# Altium project PamisBrainBoard.PrjPcb (part 1 of 2)
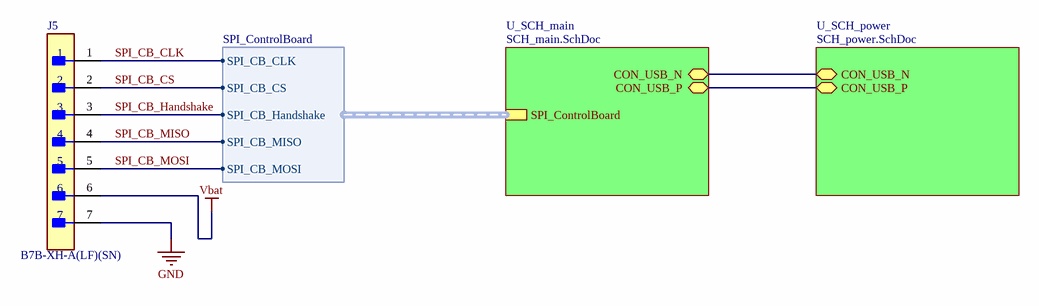
[diagram p0: SCH_Groupe.SchDoc]
3 sheets, 48 parts. Net scope: hierarchical (ports join the sheet entries above them; power ports are global).
Board file: PCB_BrainBoard.PcbDoc
Sheets:
  SCH_Groupe.SchDoc
    U_SCH_power = SCH_Power.SchDoc
    U_SCH_main = SCH_main.SchDoc

## Sheet SCH_Groupe.SchDoc: Brain Board
size 297 x 209 mm; DrawnBy: Adnan CATAL; SheetNumber: 1; SheetTotal: 3; Designer: Adnan CATAL; Projet: Pamis; Title2: Main shematics

### Parts
J5  B7B-XH-A(LF)(SN)  [FP-B7B-XH-A_LF_SN-MFG]

### Sub-sheets
U_SCH_main = SCH_main.SchDoc: SPI_ControlBoard (harness SPI_ControlBoard), CON_USB_P (bidir), CON_USB_N (bidir)
U_SCH_power = SCH_power.SchDoc: CON_USB_P (bidir), CON_USB_N (bidir)

### Harnesses
SPI_ControlBoard: SPI_CB_CLK, SPI_CB_CS, SPI_CB_Handshake, SPI_CB_MOSI, SPI_CB_MISO

### Nets
GND: J5.7
Vbat: J5.6
CON_USB_N: sheet U_SCH_power/CON_USB_N, sheet U_SCH_main/CON_USB_N
CON_USB_P: sheet U_SCH_power/CON_USB_P, sheet U_SCH_main/CON_USB_P
SPI_CB_CLK: J5.1 ; sheet U_SCH_main/SPI_ControlBoard.SPI_CB_CLK
SPI_CB_CS: J5.2 ; sheet U_SCH_main/SPI_ControlBoard.SPI_CB_CS
SPI_CB_Handshake: J5.3 ; sheet U_SCH_main/SPI_ControlBoard.SPI_CB_Handshake
SPI_CB_MISO: J5.4 ; sheet U_SCH_main/SPI_ControlBoard.SPI_CB_MISO
SPI_CB_MOSI: J5.5 ; sheet U_SCH_main/SPI_ControlBoard.SPI_CB_MOSI

### Notes on the sheet
- Project/Equipment
- Document
- Designer
- Drawn by
- Check.by
- File
- Last Mod.
- Print Date
- Sheet
- of
- Size
- A4
- Rev

### Library data of the parts
J5 = CMP-17439-000323-2: CONN HEADER VERT 7POS 2.5MM; Current Rating: 3A; Voltage Rating: 250V; Number of Contacts: 7; Mated Stacking Heights: 9.8mm; Insulation Resistance: 1GR; Contact Resistance: 20mR; Wire/Cable Gauge: 22AWG; Contact Finish - Mating: TIN; Orientation: Straight; REACH SVHC: No SVHC; Max Operating Temperature: 85°C; Housing Color: White; Pitch: 2.5mm; Mount: Through Hole; Packaging: Bulk; Depth: 5.75mm; Series: XH; Min Operating Temperature: -25°C; Length: 19.9mm; Connector Type: Header; Number of Positions: 7; Color: Natural; Max Current Rating: 3A; Lead Pitch: 2.5mm; Termination: Solder; Fastening Type: Detent; Flammability Rating: UL94 V-0; Voltage Rating (AC): 250V; Lead Free: Lead Free; Contact Material: Brass; Max Voltage Rating (AC): 250V; Contact Type: Male Pin; Housing Material: Polyamide; Insulation Color: Natural; Contact Shape: Square; Number of Rows: 1; Contact Plating: Tin; Insulation Material: Nylon

## Sheet SCH_Power.SchDoc: Brain Board
size 297 x 209 mm; SPICEModelCacheCRLNPAUY: <root> / <DocumentId>CRLNPAUY</DocumentId> / </root>; CreateDate: 26/10/2026; Projet: Pamis; DrawnBy: Adnan CATAL; SheetNumber: 3; SheetTotal: 3; Designer: Adnan CATAL; Title2: Power Schematic
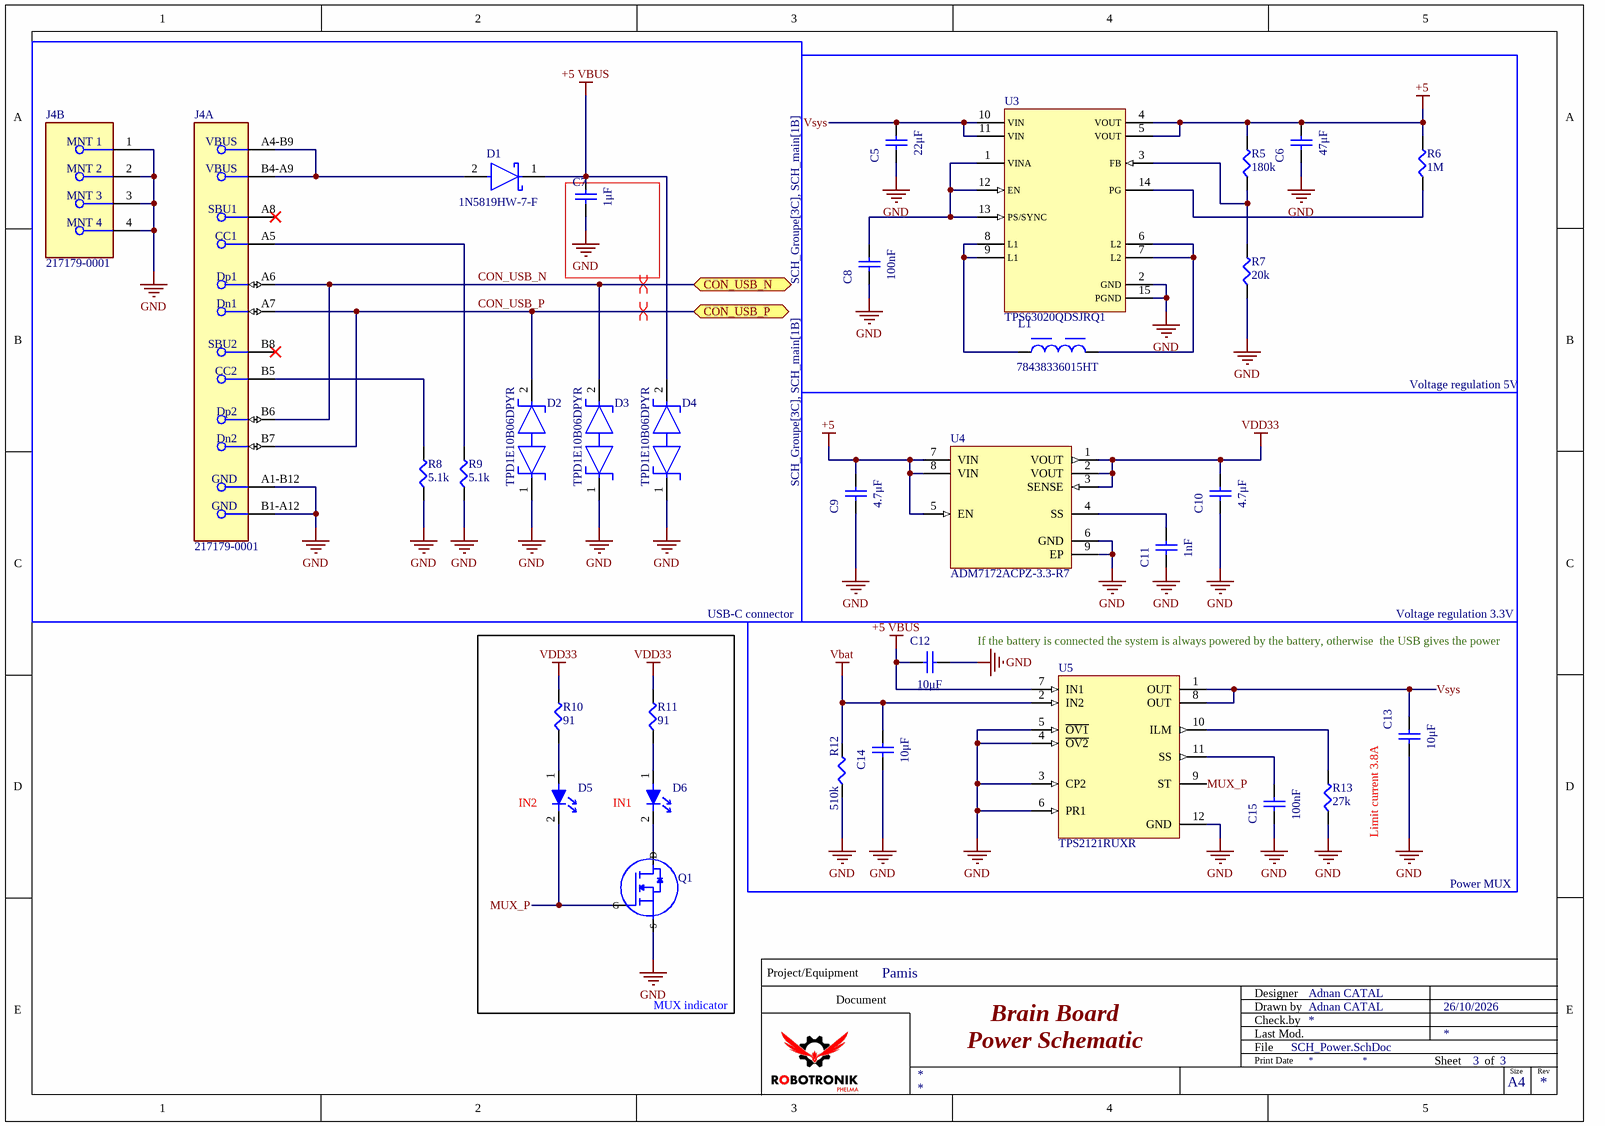
[diagram p1: SCH_Power.SchDoc]

### Parts
C5  22μF  [WCAP-CSGP_0805_L2W1.25H1.25]
C6  47μF  [WCAP-CSGP_0805_L2W1.25H1.25]
C7  1μF  [WCAP-CSGP_0603_L1.6W0.8H0.8_Reflow]
C8  100nF  [WCAP-CSGP_0805_L2W1.25H0.8_Reflow]
C9  4.7μF  [WCAP-CSGP_0603_L1.6W0.8H0.8_Reflow]
C10  4.7μF  [WCAP-CSGP_0603_L1.6W0.8H0.8_Reflow]
C11  1nF  [WCAP-CSGP_0603_L1.6W0.8H0.8_Reflow]
C12  10μF  [WCAP-CSGP_0805_L2W1.25H1.25]
C13  10μF  [WCAP-CSGP_0805_L2W1.25H1.25]
C14  10μF  [WCAP-CSGP_0805_L2W1.25H1.25]
C15  100nF  [WCAP-CSGP_0805_L2W1.25H0.8_Reflow]
D1  1N5819HW-7-F  [FP-SOD123-IPC_A]
D2  TPD1E10B06DPYR  [FP-DPY0002A-MFG]
D3  TPD1E10B06DPYR  [FP-DPY0002A-MFG]
D4  TPD1E10B06DPYR  [FP-DPY0002A-MFG]
D5  Yellow Green  [DIOC2012X30N]  (value not drawn)
D6  Yellow Green  [DIOC2012X30N]  (value not drawn)
J4  217179-0001  [FP-2171790001-MFG]  (parts A,B of 2)
L1  78438336015HT  [WE-MAIA_3020HT]
Q1  DMN2058U-7  [SOT90P240X110-3N]  (value not drawn)
R5  180k  [SMD-0603-RES]
R6  1M  [SMD-0603-RES]
R7  20k  [SMD-0603-RES]
R8  5.1k  [SMD-0603-RES]
R9  5.1k  [SMD-0603-RES]
R10  91  [SMD-0603-RES]
R11  91  [SMD-0603-RES]
R12  510k  [SMD-0603-RES]
R13  27k  [SMD-0603-RES]
U3  TPS63020QDSJRQ1  [SON50P300X400X100-15N]
U4  ADM7172ACPZ-3.3-R7  [SON50P300X300X80-9N]
U5  TPS2121RUXR  [IC_TPS2121RUXR]

### Ports
CON_USB_N (bidir, see SCH_Groupe[3C], SCH_main[1B]), CON_USB_P (bidir, see SCH_Groupe[3C], SCH_main[1B])

### Nets
+5: C6.2 C9.2 R5.2 R6.2 U3.4(VOUT) U3.5(VOUT) U4.5(EN) U4.7(VIN) U4.8(VIN)
+5 VBUS: C7.2 C12.1 D1.1(C) D4.2 U5.7(IN1)
GND: C5.1 C6.1 C7.1 C8.1 C9.1 C10.1 C11.1 C12.2 C13.1 C14.1 C15.1 D2.1 D3.1 D4.1 J4.1(MNT_1) J4.2(MNT_2) J4.3(MNT_3) J4.4(MNT_4) J4.A1-B12(GND) J4.B1-A12(GND) Q1.2(S) R7.1 R8.1 R9.1 R12.1 R13.1 U3.2(GND) U3.15(PGND) U4.6(GND) U4.9(EP) U5.3(CP2) U5.4(~{OV2}) U5.5(~{OV1}) U5.6(PR1) U5.12(GND)
Vbat: C14.2 R12.2 U5.2(IN2)
VDD33: C10.2 R10.2 R11.2 U4.1(VOUT) U4.2(VOUT) U4.3(SENSE)
CON_USB_N: D3.2 J4.A6(Dp1) J4.B6(Dp2) ; port CON_USB_N
CON_USB_P: D2.2 J4.A7(Dn1) J4.B7(Dn2) ; port CON_USB_P
MUX_P: D5.2 Q1.1(G) U5.9(ST)
Vsys: C5.2 C13.2 U3.10(VIN) U3.11(VIN) U5.1(OUT) U5.8(OUT)
NetC8_2: C8.2 U3.1(VINA) U3.12(EN) U3.13(PS/SYNC)
NetC11_2: C11.2 U4.4(SS)
NetC15_2: C15.2 U5.11(SS)
NetD1_2: D1.2(A) J4.A4-B9(VBUS) J4.B4-A9(VBUS)
NetD5_1: D5.1 R10.1
NetD6_1: D6.1 R11.1
NetD6_2: D6.2 Q1.3(D)
NetJ4_A5: J4.A5(CC1) R9.2
NetJ4_B5: J4.B5(CC2) R8.2
NetL1_1: L1.1 U3.8(L1) U3.9(L1)
NetL1_2: L1.2 U3.6(L2) U3.7(L2)
NetR5_1: R5.1 R7.2 U3.3(FB)
NetR6_1: R6.1 U3.14(PG)
NetR13_2: R13.2 U5.10(ILM)

Not connected (* = marked no-connect by the designer): J4 A8(SBU1)* B8(SBU2)*

### Layout directives
differential pair; differential pair class DIFF_USB: CON_USB_N, CON_USB_P

### Notes on the sheet
- Voltage regulation 5V
- USB-C connector
- If the battery is connected the system is always powered by the battery, otherwise  the USB gives the power
- Voltage regulation 3.3V
- (near D5) IN2
- (near D6) IN1
- Limit current 3.8A
- Power MUX
- MUX indicator
- Project/Equipment
- Document
- Designer
- Drawn by
- Check.by
- File
- Last Mod.
- Print Date
- Sheet
- of
- Size
- A4
- Rev

### Library data of the parts
C5 = 885012107019: WCAP-CSGP Multilayer Ceramic Chip Capacitor, General Purpose, size 0805, 22μF, 25V; Manufacturer: Wurth Elektronik; Case/Size Code: 0805; Capacitance Tolerance: +/-20%; Ceramic Type: X5R Class II; Dissipation Factor: 10%; Insulation Resistance: 0.002GΩ; Technical Reference: X5R0805226M025DFCT10000; Manufacturer Part Number: 885012107019; Category: Multilayer Ceramic Chip Capacitors; Match Code: WCAP-CSGP; ComponentLink1Description: Website Link; ComponentLink1URL: https://www.we-online.com/redexpert/article/885012107019?ad; ComponentLink2Description: Datasheet Link; ComponentLink2URL: https://www.we-online.com/redexpert/spec/885012107019?ad; Mount: Surface Mount; Min Operating Temperature: -55°C; Max Operating Temperature: 85°C; Packaging: Tape and Reel; Length: 2mm; Width: 1.25mm; Height: 1.25mm; Capacitance: 22μF; Rated Voltage (DC): 25V
C6 = 885012107006: WCAP-CSGP Multilayer Ceramic Chip Capacitor, General Purpose, size 0805, 47μF, 6.3V; Manufacturer: Wurth Elektronik; Case/Size Code: 0805; Capacitance Tolerance: +/-20%; Ceramic Type: X5R; Dissipation Factor: 10%; Insulation Resistance: 0.002GΩ; Technical Reference: X5R0805476M6R3DFCT10000; Manufacturer Part Number: 885012107006; Category: Multilayer Ceramic Chip Capacitors; Match Code: WCAP-CSGP; ComponentLink1Description: Website Link; ComponentLink1URL: https://www.we-online.com/redexpert/article/885012107006?ad; ComponentLink2Description: Datasheet Link; ComponentLink2URL: https://www.we-online.com/redexpert/spec/885012107006?ad; Mount: Surface Mount; Min Operating Temperature: -55°C; Max Operating Temperature: 85°C; Packaging: Tape and Reel; Length: 2mm; Width: 1.25mm; Height: 1.25mm; Capacitance: 47μF; Rated Voltage (DC): 6.3V
C7 = 885012106003: WCAP-CSGP Multilayer Ceramic Chip Capacitor, General Purpose, size 0603, 1μF, 6.3V; Manufacturer: Wurth Elektronik; Case/Size Code: 0603; Capacitance Tolerance: +/-20%; Ceramic Type: X5R; Dissipation Factor: 10%; Insulation Resistance: 0.1GΩ; Technical Reference: X5R0603105M6R3DFCT10000; Manufacturer Part Number: 885012106003; Category: Multilayer Ceramic Chip Capacitors; Match Code: WCAP-CSGP; ComponentLink1Description: Website Link; ComponentLink1URL: https://www.we-online.com/redexpert/article/885012106003?ad; ComponentLink2Description: Datasheet Link; ComponentLink2URL: https://www.we-online.com/redexpert/spec/885012106003?ad; Mount: Surface Mount; Min Operating Temperature: -55°C; Max Operating Temperature: 85°C; Packaging: Tape and Reel; Length: 1.6mm; Width: 0.8mm; Height: 0.8mm; Capacitance: 1μF; Rated Voltage (DC): 6.3V
C8 C15 = 885012207045: WCAP-CSGP Multilayer Ceramic Chip Capacitor, General Purpose, size 0805, 100nF, 16V; Manufacturer: Wurth Elektronik; Case/Size Code: 0805; Capacitance Tolerance: +/-10%; Ceramic Type: X7R; Dissipation Factor: 3.5%; Insulation Resistance: 5GΩ; Technical Reference: X7R0805104K016DFCT10000; Manufacturer Part Number: 885012207045; Category: Multilayer Ceramic Chip Capacitors; Match Code: WCAP-CSGP; ComponentLink1Description: Website Link; ComponentLink1URL: https://www.we-online.com/redexpert/article/885012207045?ad; ComponentLink2Description: Datasheet Link; ComponentLink2URL: https://www.we-online.com/redexpert/spec/885012207045?ad; Mount: Surface Mount; Min Operating Temperature: -55°C; Max Operating Temperature: 125°C; Packaging: Tape and Reel; Length: 2mm; Width: 1.25mm; Height: 0.8mm; Capacitance: 100nF; Rated Voltage (DC): 16V
C9 C10 = 885012106012: WCAP-CSGP Multilayer Ceramic Chip Capacitor, General Purpose, size 0603, 4.7μF, 10V; Manufacturer: Wurth Elektronik; Case/Size Code: 0603; Capacitance Tolerance: +/-20%; Ceramic Type: X5R; Dissipation Factor: 10%; Insulation Resistance: 0.02GΩ; Technical Reference: X5R0603475M010DFCT10000; Manufacturer Part Number: 885012106012; Category: Multilayer Ceramic Chip Capacitors; Match Code: WCAP-CSGP; ComponentLink1Description: Website Link; ComponentLink1URL: https://www.we-online.com/redexpert/article/885012106012?ad; ComponentLink2Description: Datasheet Link; ComponentLink2URL: https://www.we-online.com/redexpert/spec/885012106012?ad; Mount: Surface Mount; Min Operating Temperature: -55°C; Max Operating Temperature: 85°C; Packaging: Tape and Reel; Length: 1.6mm; Width: 0.8mm; Height: 0.8mm; Capacitance: 4.7μF; Rated Voltage (DC): 10V
C11 = 885012006029: WCAP-CSGP Multilayer Ceramic Chip Capacitor, General Purpose, size 0603, 1nF, 16V; Manufacturer: Wurth Elektronik; Case/Size Code: 0603; Capacitance Tolerance: +/-5%; Ceramic Type: NP0; Insulation Resistance: 10GΩ; Q Factor: 1000; Technical Reference: NP00603102J016DFCT10000; Manufacturer Part Number: 885012006029; Category: Multilayer Ceramic Chip Capacitors; Match Code: WCAP-CSGP; ComponentLink1Description: Website Link; ComponentLink1URL: https://www.we-online.com/redexpert/article/885012006029?ad; ComponentLink2Description: Datasheet Link; ComponentLink2URL: https://www.we-online.com/redexpert/spec/885012006029?ad; Mount: Surface Mount; Min Operating Temperature: -55°C; Max Operating Temperature: 125°C; Packaging: Tape and Reel; Length: 1.6mm; Width: 0.8mm; Height: 0.8mm; Capacitance: 1nF; Rated Voltage (DC): 16V
C12-C14 = 885012107027: WCAP-CSGP Multilayer Ceramic Chip Capacitor, General Purpose, size 0805, 10μF, 25V; Manufacturer: Wurth Elektronik; Case/Size Code: 0805; Capacitance Tolerance: +/-10%; Ceramic Type: X5R Class II; Dissipation Factor: 12.5%; Insulation Resistance: 0.005GΩ; Technical Reference: X5R0805106K025DFCT10000; Manufacturer Part Number: 885012107027; Category: Multilayer Ceramic Chip Capacitors; Match Code: WCAP-CSGP; ComponentLink1Description: Website Link; ComponentLink1URL: https://www.we-online.com/redexpert/article/885012107027?ad; ComponentLink2Description: Datasheet Link; ComponentLink2URL: https://www.we-online.com/redexpert/spec/885012107027?ad; Mount: Surface Mount; Min Operating Temperature: -55°C; Max Operating Temperature: 85°C; Packaging: Tape and Reel; Length: 2mm; Width: 1.25mm; Height: 1.25mm; Capacitance: 10μF; Rated Voltage (DC): 25V
D1 = CMP-0303-00003-3: DIODE SCHOTTKY 40V 1A SOD123; Forward Voltage: 450mV; Capacitance: 110pF; Max Forward Surge Current (Ifsm): 25A; Peak Reverse Current: 50uA; Polarity: Standard; Element Configuration: Single; Max Power Dissipation: 450mW; Min Operating Temperature: -65°C; Package Quantity: 3000; Contact Plating: Tin; Weight: 0.000353oz; Max Repetitive Reverse Voltage (Vrrm): 40V; Max Reverse Voltage (DC): 40V; Height: 1.25mm; Average Rectified Current: 1A; Width: 1.7mm; Case/Package: SOD-123-2; Lead Free: Lead Free; Max Operating Temperature: 125°C; Current Rating: 1A; Termination: SMD/SMT; Forward Current: 1A; Radiation Hardening: No; Number of Pins: 2; Length: 2.85mm; Voltage Rating (DC): 40V; REACH SVHC: No SVHC; Peak Non-Repetitive Surge Current: 25A; Packaging: Tape and Reel; Output Current: 1A
D2-D4 = CMP-0326-00004-4: TVS DIODE 5.5V 14V 2X1SON; Leakage Current: 100nA; Min Breakdown Voltage: 6V; Number of Channels: 1; ESD Protection: Yes; Power Line Protection: No; Test Current: 1mA; Interface: GPIO; Element Configuration: Single; Peak Pulse Current: 5A; Direction: Bidirectional; Peak Pulse Power: 90W; Capacitance: 12pF; Composition: Zener; Packaging: Tape and Reel; Number of Pins: 2; Breakdown Voltage: 6V; Radiation Hardening: No; Min Operating Temperature: -40°C; Contact Plating: Gold; Lead Free: Lead Free; Height: 0.35mm; REACH SVHC: No SVHC; Case/Package: 0402; Max Operating Temperature: 125°C; Width: 0.7mm; Clamping Voltage: 14V; Package Quantity: 1; Max Reverse Leakage Current: 100nA; Working Voltage: 5.5V; Length: 1.1mm; Number of Bidirectional Channels: 1; Reverse Standoff Voltage: 5.5V
D5 D6 = 2545731: 573nm 120° 1.6V~2.4V Green Transparent Yellow SMD 2mm × 1.5mm; Manufacturer: RS Pro; Supplier: RS; Supplier Part Number: 2545731; Manufacturer Part Number: 2545731; Category: LEDs; Stock: 7800; Pricing: 50=0,038, 250=0,037, 500=0,034, 1250=0,03, 5000=0,022 (EUR); Harmonized Tariff Schedule (HTS) Code: 8541.40.20.00; Introduction Date: 2022-12-15
J4 = CMP-04767-000028-2: CONN RCP USB2.0 TYP C 24P SMD RA; NexarPartId: 117190526; Gender: Receptacle; Number of Contacts: 16; Current Rating: 1.25A; Voltage Rating: 30V; Min Operating Temperature: -40°C; USB Standard: USB 2.0; Height: 3.36mm; Contact Material: Gold, Nickel; Max Operating Temperature: 85°C
L1 = CMP-03913-159362465-1: Power Inductor, 1.5UH, 5.2A, Shielded Rohs Compliant: Yes; Manufacturer: Wurth Elektronik; Manufacturer Lifecycle Status: ACTIVE; DC Resistance (DCR): 35.2mΩ; Value: 1.5µH; Saturation Current: 2.4A; YEOL: 1 = Estimated lifetime > 10 years; Supplier: RS; Supplier Part Number: 426953; Manufacturer Part Number: 78438336015HT; RoHS: Compliant; Category: Fixed Inductors; Stock: 995; Pricing: 5=2,168, 50=2,056, 100=1,906, 500=1,754 (EUR); Ambient Temperature Range High: 110°C; Ambient Temperature Range Low: -55°C; Height: 2mm; Length: 3mm; Lifecycle Status: Production; Max Operating Temperature: 150°C; Min Operating Temperature: -55°C; Width: 3mm; ComponentLink1URL: https://datasheet.octopart.com:443/78438336015HT-Wurth-Elektronik-datasheet-190369251.pdf?src-supplier=Wurth+Elektronik; ComponentLink1Description: https://datasheet.octopart.com:443/78438336015HT-Wurth-Elektronik-datasheet-190369251.pdf?src-supplier=Wurth+Elektronik
Q1 = DMN2058U-7: Diodes Zetex DMN2058U N-Channel MOSFET, Vds=20 V, 4.6 A, SOT-23, SMD, 3-Pin; Manufacturer: Diodes Inc.; Continuous Drain Current (ID): 4.6A; Drain to Source Resistance: 35mΩ; Drain to Source Voltage (Vds): 20V; Max Power Dissipation: 1.13W; Number of Elements: 1; Supplier: RS; Supplier Part Number: 1333377; Manufacturer Part Number: DMN2058U-7; RoHS: Compliant; Category: MOSFETs; Stock: 16000; Pricing: 50=0,225 (EUR); Case/Package: SOT-23; China RoHS: Compliant; Country of Origin: Mainland China; Export Control Classification Number (ECCN) Code: EAR99; Introduction Date: 2016-09-13; Lifecycle Status: Production; Max Operating Temperature: 150°C; Min Breakdown Voltage: 20V; Min Operating Temperature: -55°C; Number of Terminals: 3; REACH SVHC: Unaffected; Schedule B: 8541290080, 8541290080|8541290080|8541290080|8541290080|8541290080; ComponentLink1URL: https://datasheet.octopart.com:443/DMN2058U-7-Diodes-Inc.-datasheet-180553089.pdf?src-supplier=Newark; ComponentLink1Description: https://datasheet.octopart.com:443/DMN2058U-7-Diodes-Inc.-datasheet-180553089.pdf?src-supplier=Newark; ComponentLink2URL: https://datasheet.octopart.com:443/DMN2058U-7-Diodes-Inc.-datasheet-76801221.pdf?src-supplier=Newark; ComponentLink2Description: https://datasheet.octopart.com:443/DMN2058U-7-Diodes-Inc.-datasheet-76801221.pdf?src-supplier=Newark; ComponentLink3URL: https://datasheet.octopart.com:443/DMN2058U-7-Diodes-Inc.-datasheet-128204454.pdf?src-supplier=TME; ComponentLink3Description: https://datasheet.octopart.com:443/DMN2058U-7-Diodes-Inc.-datasheet-128204454.pdf?src-supplier=TME; ComponentLink4URL: https://sigma.octopart.com:443/138706058/technical_drawing/Diodes-Inc.-DMN2058U-7.pdf?src-supplier=Diodes+Inc+SCT; ComponentLink4Description: https://sigma.octopart.com:443/138706058/technical_drawing/Diodes-Inc.-DMN2058U-7.pdf?src-supplier=Diodes+Inc+SCT
R5 = ERJ-PA3F1803V: RES SMD 180K OHM 1% 1/4W 0603; Manufacturer: Panasonic Electronic Components; Factory Stock: 0; Unit Price (USD): 0.02372; @ qty: 1500; Minimum Quantity: 1; Power (Watts): 0.25W, 1/4W; Temperature Coefficient: ±100ppm/°C; Part Number: ERJ-PA3F1803V; Datasheets: https://industrial.panasonic.com/cdbs/www-data/pdf/RDA0000/AOA0000C243.pdf; Image: //media.digikey.com/Photos/Panasonic%20Photos/MFG_ERJ-P6W%20Series.jpg; Digi-Key Part Number: P180KBYCT-ND; Quantity Available: 3195; Packaging: Cut Tape (CT); Series: ERJ; Part Status: Active; Value: 180k; Tolerance: ±1%; Composition: Thick Film; Features: Automotive AEC-Q200, Pulse Withstanding; Operating Temperature: -55°C ~ 155°C; Package / Case: 0603 (1608 Metric); Supplier Device Package: 0603; Size / Dimension: 0.063" L x 0.031" W (1.60mm x 0.80mm); Height - Seated (Max): 0.022" (0.55mm); Number of Terminations: 2; Failure Rate: -
R6 = ERJ-PA3F1004V: RES SMD 1M OHM 1% 1/4W 0603; Manufacturer: Panasonic Electronic Components; Factory Stock: 0; Unit Price (USD): 0.02372; @ qty: 1500; Minimum Quantity: 1; Power (Watts): 0.25W, 1/4W; Temperature Coefficient: ±100ppm/°C; Part Number: ERJ-PA3F1004V; Datasheets: https://industrial.panasonic.com/cdbs/www-data/pdf/RDA0000/AOA0000C243.pdf; Image: //media.digikey.com/Photos/Panasonic%20Photos/MFG_ERJ-P6W%20Series.jpg; Digi-Key Part Number: P1.0MBYCT-ND; Quantity Available: 16687; Packaging: Cut Tape (CT); Series: ERJ; Part Status: Active; Value: 1M; Tolerance: ±1%; Composition: Thick Film; Features: Automotive AEC-Q200, Pulse Withstanding; Operating Temperature: -55°C ~ 155°C; Package / Case: 0603 (1608 Metric); Supplier Device Package: 0603; Size / Dimension: 0.063" L x 0.031" W (1.60mm x 0.80mm); Height - Seated (Max): 0.022" (0.55mm); Number of Terminations: 2; Failure Rate: -
R7 = ERJ-PA3F2002V: RES SMD 20K OHM 1% 1/4W 0603; Manufacturer: Panasonic Electronic Components; Factory Stock: 0; Unit Price (USD): 0.02372; @ qty: 1500; Minimum Quantity: 1; Power (Watts): 0.25W, 1/4W; Temperature Coefficient: ±100ppm/°C; Part Number: ERJ-PA3F2002V; Datasheets: https://industrial.panasonic.com/cdbs/www-data/pdf/RDA0000/AOA0000C243.pdf; Image: //media.digikey.com/Photos/Panasonic%20Photos/MFG_ERJ-P6W%20Series.jpg; Digi-Key Part Number: P20KBYCT-ND; Quantity Available: 10542; Packaging: Cut Tape (CT); Series: ERJ; Part Status: Active; Value: 20k; Tolerance: ±1%; Composition: Thick Film; Features: Automotive AEC-Q200, Pulse Withstanding; Operating Temperature: -55°C ~ 155°C; Package / Case: 0603 (1608 Metric); Supplier Device Package: 0603; Size / Dimension: 0.063" L x 0.031" W (1.60mm x 0.80mm); Height - Seated (Max): 0.022" (0.55mm); Number of Terminations: 2; Failure Rate: -
R8 R9 = ERJ-PA3F5101V: RES SMD 5.1K OHM 1% 1/4W 0603; Manufacturer: Panasonic Electronic Components; Factory Stock: 0; Unit Price (USD): 0.02372; @ qty: 1500; Minimum Quantity: 1; Power (Watts): 0.25W, 1/4W; Temperature Coefficient: ±100ppm/°C; Part Number: ERJ-PA3F5101V; Datasheets: https://industrial.panasonic.com/cdbs/www-data/pdf/RDA0000/AOA0000C243.pdf; Image: //media.digikey.com/Photos/Panasonic%20Photos/MFG_ERJ-P6W%20Series.jpg; Digi-Key Part Number: P5.1KBYCT-ND; Quantity Available: 15990; Packaging: Cut Tape (CT); Series: ERJ; Part Status: Active; Value: 5.1k; Tolerance: ±1%; Composition: Thick Film; Features: Automotive AEC-Q200, Pulse Withstanding; Operating Temperature: -55°C ~ 155°C; Package / Case: 0603 (1608 Metric); Supplier Device Package: 0603; Size / Dimension: 0.063" L x 0.031" W (1.60mm x 0.80mm); Height - Seated (Max): 0.022" (0.55mm); Number of Terminations: 2; Failure Rate: -
R10 R11 = ERJ-3EKF91R0V: RES SMD 91 OHM 1% 1/10W 0603; Manufacturer: Panasonic Electronic Components; Factory Stock: 0; Unit Price (USD): 0.00379; @ qty: 1500; Minimum Quantity: 1; Power (Watts): 0.1W, 1/10W; Temperature Coefficient: ±100ppm/°C; Part Number: ERJ-3EKF91R0V; Datasheets: http://industrial.panasonic.com/www-cgi/jvcr13pz.cgi?E+PZ+3+AOA0002+ERJ3EKF91R0V+7+WW; Image: //media.digikey.com/Photos/Panasonic%20Photos/MFG_ERJ-P6W%20Series.jpg; Digi-Key Part Number: P91.0HCT-ND; Quantity Available: 54677; Packaging: Cut Tape (CT); Series: ERJ; Part Status: Active; Value: 91; Tolerance: ±1%; Composition: Thick Film; Features: Automotive AEC-Q200; Operating Temperature: -55°C ~ 155°C; Package / Case: 0603 (1608 Metric); Supplier Device Package: 0603; Size / Dimension: 0.063" L x 0.031" W (1.60mm x 0.80mm); Height - Seated (Max): 0.022" (0.55mm); Number of Terminations: 2; Failure Rate: -
R12 = ERJ-PA3F5103V: RES SMD 510K OHM 1% 1/4W 0603; Manufacturer: Panasonic Electronic Components; Factory Stock: 0; Unit Price (USD): 0.02372; @ qty: 1500; Minimum Quantity: 1; Power (Watts): 0.25W, 1/4W; Temperature Coefficient: ±100ppm/°C; Part Number: ERJ-PA3F5103V; Datasheets: https://industrial.panasonic.com/cdbs/www-data/pdf/RDA0000/AOA0000C243.pdf; Image: //media.digikey.com/Photos/Panasonic%20Photos/MFG_ERJ-P6W%20Series.jpg; Digi-Key Part Number: P510KBYCT-ND; Quantity Available: 3355; Packaging: Cut Tape (CT); Series: ERJ; Part Status: Active; Value: 510k; Tolerance: ±1%; Composition: Thick Film; Features: Automotive AEC-Q200, Pulse Withstanding; Operating Temperature: -55°C ~ 155°C; Package / Case: 0603 (1608 Metric); Supplier Device Package: 0603; Size / Dimension: 0.063" L x 0.031" W (1.60mm x 0.80mm); Height - Seated (Max): 0.022" (0.55mm); Number of Terminations: 2; Failure Rate: -
R13 = ERJ-3EKF2702V: RES SMD 27K OHM 1% 1/10W 0603; Manufacturer: Panasonic Electronic Components; Factory Stock: 0; Unit Price (USD): 0.00379; @ qty: 1500; Minimum Quantity: 1; Power (Watts): 0.1W, 1/10W; Temperature Coefficient: ±100ppm/°C; Part Number: ERJ-3EKF2702V; Datasheets: http://industrial.panasonic.com/www-cgi/jvcr13pz.cgi?E+PZ+3+AOA0002+ERJ3EKF2702V+7+WW; Image: //media.digikey.com/Photos/Panasonic%20Photos/MFG_ERJ-P6W%20Series.jpg; Digi-Key Part Number: P27.0KHCT-ND; Quantity Available: 16002; Packaging: Cut Tape (CT); Series: ERJ; Part Status: Active; Value: 27k; Tolerance: ±1%; Composition: Thick Film; Features: Automotive AEC-Q200; Operating Temperature: -55°C ~ 155°C; Package / Case: 0603 (1608 Metric); Supplier Device Package: 0603; Size / Dimension: 0.063" L x 0.031" W (1.60mm x 0.80mm); Height - Seated (Max): 0.022" (0.55mm); Number of Terminations: 2; Failure Rate: -
U3 = TPS63020QDSJRQ1: Switching Regulator, Current-mode, 2A, 2600kHz Switching Freq-Max, BICMOS, PDSO14; Manufacturer: Texas Instruments; Manufacturer Lifecycle Status: ACTIVE; Max Duty Cycle: 100%; Max Supply Voltage: 5.5V; Max Junction Temperature (Tj): 125°C; Min Input Voltage: 1.8V; Min Output Voltage: 1.2V; Number of Outputs: 1; Output Configuration: Positive; Output Type: Adjustable; Quiescent Current: 50µA; Switching Frequency: 2.4MHz; Synchronous Rectifier: Yes; Topology: Buck-Boost; Supplier: DigiKey; Supplier Part Number: 296-43286-1-ND; Manufacturer Part Number: TPS63020QDSJRQ1; RoHS: Compliant; Category: Voltage Regulators - Switching; Stock: 2665; Height: 1mm; Lead Free: Lead Free; Length: 3mm; Lifecycle Status: Production; Max Operating Temperature: 125°C; Max Output Voltage: 5.5V; Min Operating Temperature: -40°C; Min Supply Voltage: 1.8V; Mounting Technology: Surface Mount; Pins: 14; Output Current: 2A; Packaging: Tape & Reel (TR); Schedule B: 8542390000; Thickness: 900µm; Width: 4mm; ComponentLink1URL: https://datasheet.octopart.com:443/TPS63020QDSJRQ1-Texas-Instruments-datasheet-49823712.pdf?src-supplier=Texas+Instruments; ComponentLink1Description: https://datasheet.octopart.com:443/TPS63020QDSJRQ1-Texas-Instruments-datasheet-49823712.pdf?src-supplier=Texas+Instruments; ComponentLink2URL: https://octopart.com:443/opatz8j6/c1?t=_PlhL9x2DhC5kj_RspDZiegst2Pjcy_9vSA66_zuppjomAtxh8eeCyEWgMGgfXy8gLa5JUP9H_sFY7m0oo4wV1IqgyNWPgIvJJupqtj6dfd8itVF4uXJuBAZm-8-5KdURT-rscAAk4exrppObfuTgysDWqXYCWa6g4Er1_Yh9dDDJDseR-GA9P54EzHN3SPr7356tuSvadfqr47za5CxFVn9TQNg0n6ftYFjG23QVqjVCqxpDU9_do17Rge9-GpcbffJGRMgW8xBeG-p9jOxI28gxcA3t1lsqEAUe8NkT9T-De4ixHPzJWQdEQ21idKCidjl-nWmjapctRLk1RCL25uQiA4SFrXYm9BPX9ccWOLSYwzhdM6cw773HQiK6sNIWq2y8fEWUQ-w&src-supplier=Texas+Instruments; ComponentLink2Description: https://octopart.com:443/opatz8j6/c1?t=_PlhL9x2DhC5kj_RspDZiegst2Pjcy_9vSA66_zuppjomAtxh8eeCyEWgMGgfXy8gLa5JUP9H_sFY7m0oo4wV1IqgyNWPgIvJJupqtj6dfd8itVF4uXJuBAZm-8-5KdURT-rscAAk4exrppObfuTgysDWqXYCWa6g4Er1_Yh9dDDJDseR-GA9P54EzHN3SPr7356tuSvadfqr47za5CxFVn9TQNg0n6ftYFjG23QVqjVCqxpDU9_do17Rge9-GpcbffJGRMgW8xBeG-p9jOxI28gxcA3t1lsqEAUe8NkT9T-De4ixHPzJWQdEQ21idKCidjl-nWmjapctRLk1RCL25uQiA4SFrXYm9BPX9ccWOLSYwzhdM6cw773HQiK6sNIWq2y8fEWUQ-w&src-supplier=Texas+Instruments; ComponentLink3URL: https://sigma.octopart.com:443/49262683/technical_drawing/Texas-Instruments-TPS63020QDSJRQ1.pdf?src-supplier=Texas+Instruments; ComponentLink3Description: https://sigma.octopart.com:443/49262683/technical_drawing/Texas-Instruments-TPS63020QDSJRQ1.pdf?src-supplier=Texas+Instruments; ComponentLink4URL: https://datasheet.octopart.com:443/TPS63020QDSJRQ1-Texas-Instruments-datasheet-164483805.pdf?src-supplier=LCSC; ComponentLink4Description: https://datasheet.octopart.com:443/TPS63020QDSJRQ1-Texas-Instruments-datasheet-164483805.pdf?src-supplier=LCSC; ComponentLink5URL: https://datasheet.octopart.com:443/TPS63020QDSJRQ1-Texas-Instruments-datasheet-147652911.pdf?src-supplier=Arrow.cn; ComponentLink5Description: https://datasheet.octopart.com:443/TPS63020QDSJRQ1-Texas-Instruments-datasheet-147652911.pdf?src-supplier=Arrow.cn; ComponentLink6URL: http://sigma.octopart.com:80/reach_statement/Texas-Instruments-company-64.pdf?src-supplier=Compliance+Statements; ComponentLink6Description: http://sigma.octopart.com:80/reach_statement/Texas-Instruments-company-64.pdf?src-supplier=Compliance+Statements; ComponentLink7URL: http://sigma.octopart.com:80/conflict_mineral_statement/Texas-Instruments-company-63.pdf?src-supplier=Compliance+Statements; ComponentLink7Description: http://sigma.octopart.com:80/conflict_mineral_statement/Texas-Instruments-company-63.pdf?src-supplier=Compliance+Statements
U4 = ADM7172ACPZ-3.3-R7: LDO Regulator Pos 3.3V 2A Medical 8-Pin LFCSP EP T/R; Manufacturer: Analog Devices; Manufacturer Lifecycle Status: PRODUCTION; Accuracy: 1.5%; Dropout Voltage: 172mV; Max Supply Voltage: 6.5V; Max Junction Temperature (Tj): 125°C; Min Current Limit: 2.4A; Min Input Voltage: 2.3V; Number of Outputs: 1; Output Type: Fixed; Polarity: Positive; Quiescent Current: 700µA; Supplier: DigiKey; Supplier Part Number: 505-ADM7172ACPZ-3.3-R7CT-ND; Manufacturer Part Number: ADM7172ACPZ-3.3-R7; RoHS: Compliant; Category: Voltage Regulators - Linear; Stock: 650; Height: 800µm; Lead Free: Contains Lead; Lifecycle Status: Production; Max Operating Temperature: 125°C; Max Output current: 2A; Min Operating Temperature: -40°C; Min Supply Voltage: 2.3V; Mounting Technology: Surface Mount; Pins: 8; Number of Regulators: 1; Output Current: 2A; Output Voltage: 3.3V; Schedule B: 8542390000, 8542390000|8542390000|8542390000|8542390000|8542390000|8542390000|8542390000|8542390000|8542390000|8542390000|8542390000|8542390000|8542390000|8542390000|8542390000|8542390000|8542390000|8542390000|8542390000|8542390000|8542390000|8542390000|8542390000|85; ComponentLink1URL: https://octopart.com:443/opatz8j6/c1?t=bexnlEUvTW4ypcfmMwlQqMukjbZ1sFR7u3HjvhF_p0I1qGgozQEmLYCO0KwwxyEbZiH-eJUsaq8roSbEQNHeTfmOLjlUalTxX2N5GzImcnPMgEcSznHyXIFAgYBb3OUFi_TCl-xASKxKL_mduVIwpazwMBHKV180gVIIaW80selJWFwC_3dSvsH907UDuDBRMF5w27S6ay03f3bc-2j1dmxAk8VGKHozbFK1-BDI5ZbzN8PLYE5HGUZO9k9f8snk51CSxxJCoL8hJ4y85Qa6ezUbzh37DwBqbNGjHclmawiQR9L4M29XjpI&src-supplier=Analog+Devices; ComponentLink1Description: https://octopart.com:443/opatz8j6/c1?t=bexnlEUvTW4ypcfmMwlQqMukjbZ1sFR7u3HjvhF_p0I1qGgozQEmLYCO0KwwxyEbZiH-eJUsaq8roSbEQNHeTfmOLjlUalTxX2N5GzImcnPMgEcSznHyXIFAgYBb3OUFi_TCl-xASKxKL_mduVIwpazwMBHKV180gVIIaW80selJWFwC_3dSvsH907UDuDBRMF5w27S6ay03f3bc-2j1dmxAk8VGKHozbFK1-BDI5ZbzN8PLYE5HGUZO9k9f8snk51CSxxJCoL8hJ4y85Qa6ezUbzh37DwBqbNGjHclmawiQR9L4M29XjpI&src-supplier=Analog+Devices; ComponentLink2URL: https://datasheet.octopart.com:443/ADM7172ACPZ-3.3-R7-Analog-Devices-datasheet-48279025.pdf?src-supplier=Analog+Devices; ComponentLink2Description: https://datasheet.octopart.com:443/ADM7172ACPZ-3.3-R7-Analog-Devices-datasheet-48279025.pdf?src-supplier=Analog+Devices; ComponentLink3URL: https://datasheet.octopart.com:443/ADM7172ACPZ-3.3-R7-Analog-Devices-datasheet-38520329.pdf?src-supplier=Analog+Devices; ComponentLink3Description: https://datasheet.octopart.com:443/ADM7172ACPZ-3.3-R7-Analog-Devices-datasheet-38520329.pdf?src-supplier=Analog+Devices; ComponentLink4URL: https://datasheet.octopart.com:443/ADM7172ACPZ-3.3-R7-Analog-Devices-datasheet-28823778.pdf?src-supplier=Analog+Devices; ComponentLink4Description: https://datasheet.octopart.com:443/ADM7172ACPZ-3.3-R7-Analog-Devices-datasheet-28823778.pdf?src-supplier=Analog+Devices; ComponentLink5URL: https://datasheet.octopart.com:443/ADM7172ACPZ-3.3-R7-Analog-Devices-datasheet-138896285.pdf?src-supplier=element14+APAC; ComponentLink5Description: https://datasheet.octopart.com:443/ADM7172ACPZ-3.3-R7-Analog-Devices-datasheet-138896285.pdf?src-supplier=element14+APAC; ComponentLink6URL: https://datasheet.octopart.com:443/ADM7172ACPZ-3.3-R7-Analog-Devices-datasheet-65849620.pdf?src-supplier=Farnell; ComponentLink6Description: https://datasheet.octopart.com:443/ADM7172ACPZ-3.3-R7-Analog-Devices-datasheet-65849620.pdf?src-supplier=Farnell; ComponentLink7URL: https://datasheet.octopart.com:443/ADM7172ACPZ-3.3-R7-Analog-Devices-datasheet-85391316.pdf?src-supplier=Augswan; ComponentLink7Description: https://datasheet.octopart.com:443/ADM7172ACPZ-3.3-R7-Analog-Devices-datasheet-85391316.pdf?src-supplier=Augswan; ComponentLink8URL: http://sigma.octopart.com:80/conflict_mineral_statement/Analog-Devices-company-33.pdf?src-supplier=Compliance+Statements; ComponentLink8Description: http://sigma.octopart.com:80/conflict_mineral_statement/Analog-Devices-company-33.pdf?src-supplier=Compliance+Statements; ComponentLink9URL: https://octopart.com:443/opatz8j6/c1?t=HP60T0laTHBr78PKNnBwM6RqgywCZdwDfs00A3_xvPXBlGZMB0MdxiYSNcNKfNWJXXZOlJEZQVeS8sOHWC_yzBqUXHUhuyAnEWhaxYA1OpH5fwwc5RqAQfGZuhPNXKQY3fp4_FYGdgOr9CJ69_o4g2M3JDXRpDLIoxiy_MvhA51uKxxlNiZkDQDLf5kNOadxR7lyBtK3STOEU-5RWzyenGvMvyyu3RhliVLg2Kl7XMJxgwTREY3xRC-2EhYST3IpebnuTZ5Sou7rm9ykF39dsCzAOMJd78Yclw1sa_MxoQ00ob-bF_4OtKU&src-supplier=Compliance+Statements; ComponentLink9Description: https://octopart.com:443/opatz8j6/c1?t=HP60T0laTHBr78PKNnBwM6RqgywCZdwDfs00A3_xvPXBlGZMB0MdxiYSNcNKfNWJXXZOlJEZQVeS8sOHWC_yzBqUXHUhuyAnEWhaxYA1OpH5fwwc5RqAQfGZuhPNXKQY3fp4_FYGdgOr9CJ69_o4g2M3JDXRpDLIoxiy_MvhA51uKxxlNiZkDQDLf5kNOadxR7lyBtK3STOEU-5RWzyenGvMvyyu3RhliVLg2Kl7XMJxgwTREY3xRC-2EhYST3IpebnuTZ5Sou7rm9ykF39dsCzAOMJd78Yclw1sa_MxoQ00ob-bF_4OtKU&src-supplier=Compliance+Statements
U5 = TPS2121RUXR: 2.7-V to 22-V, 56-mΩ, 4.5-A, power mux with seamless switchover 12-VQFN-HR -40 to 125; Manufacturer: Texas Instruments; Manufacturer Lifecycle Status: ACTIVE; Max Junction Temperature (Tj): 125°C; Max Supply Voltage: 22V; Min Supply Voltage: 2.8V; Nominal Supply Current: 300µA; Number of Outputs: 1; Supplier: DigiKey; Supplier Part Number: 296-53410-1-ND; Manufacturer Part Number: TPS2121RUXR; RoHS: Compliant; Category: Power Management ICs; Stock: 13790; Height: 1mm; Length: 2.5mm; Lifecycle Status: Production; Max Operating Temperature: 125°C; Min Operating Temperature: -40°C; Pins: 12; Output Voltage: 22V; Schedule B: 8542390000, 8542390000|8542390000|8542390000|8542390000|8542390000; Thickness: 900µm; Width: 2mm; ComponentLink1URL: https://octopart.com:443/opatz8j6/c1?t=UKnKZsbDBKkWsuyviuPWhg6xnyY8YIPWRq3cGxhkt1CfXZne3rjgNtb9c8HEeUytPaPKf7af2uzAM0G6eOMOkh2IkH16zphJoSKUG-6Ea_yYAOQ3gP18ORaWd8ahF6Zf8RmVsrCt4o_VwsBjooNgHxpDYNmJeLQlCByhaq_oTqRGdi7WpnjOt0tXJGP0F5fO4d8rhyA_djt6xZO7O4pJMBUW0eJFZLB1i-juaiql1BsYqxGr4NgutUQ6UwkoV3Xj_pIx-QhqZmSQhVum4Bj9ANjIamkSlAEGTqhin75-oCdQByKwn2rfzrP7MxY01-ZaYe5651WmC_B7txcOTqRcf7lt80iDfsYBE-b8NP8aazKY0bGgVcCP00e8bu-KKwkHkhoMuZ4&src-supplier=Texas+Instruments; ComponentLink1Description: https://octopart.com:443/opatz8j6/c1?t=UKnKZsbDBKkWsuyviuPWhg6xnyY8YIPWRq3cGxhkt1CfXZne3rjgNtb9c8HEeUytPaPKf7af2uzAM0G6eOMOkh2IkH16zphJoSKUG-6Ea_yYAOQ3gP18ORaWd8ahF6Zf8RmVsrCt4o_VwsBjooNgHxpDYNmJeLQlCByhaq_oTqRGdi7WpnjOt0tXJGP0F5fO4d8rhyA_djt6xZO7O4pJMBUW0eJFZLB1i-juaiql1BsYqxGr4NgutUQ6UwkoV3Xj_pIx-QhqZmSQhVum4Bj9ANjIamkSlAEGTqhin75-oCdQByKwn2rfzrP7MxY01-ZaYe5651WmC_B7txcOTqRcf7lt80iDfsYBE-b8NP8aazKY0bGgVcCP00e8bu-KKwkHkhoMuZ4&src-supplier=Texas+Instruments; ComponentLink2URL: http://sigma.octopart.com:80/reach_statement/Texas-Instruments-company-64.pdf?src-supplier=Compliance+Statements; ComponentLink2Description: http://sigma.octopart.com:80/reach_statement/Texas-Instruments-company-64.pdf?src-supplier=Compliance+Statements; ComponentLink3URL: http://sigma.octopart.com:80/conflict_mineral_statement/Texas-Instruments-company-63.pdf?src-supplier=Compliance+Statements; ComponentLink3Description: http://sigma.octopart.com:80/conflict_mineral_statement/Texas-Instruments-company-63.pdf?src-supplier=Compliance+Statements